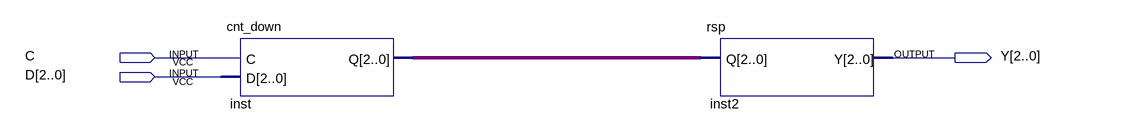
[diagram p0: schematic sheet]
// Quartus schematic lab1.bdf as structural Verilog: 2 symbols, 3 pins
module lab1 (
  input  C,
  input  [2:0] D,
  output [2:0] Y
);

  wire [2:0] inst_q;

  cnt_down inst (.C(C), .D(D), .Q(inst_q));
  rsp inst2 (.Q(inst_q), .Y(Y));
endmodule
